# Altium schematic sheet Schematic1_3.SchDoc (part 3 of 3)
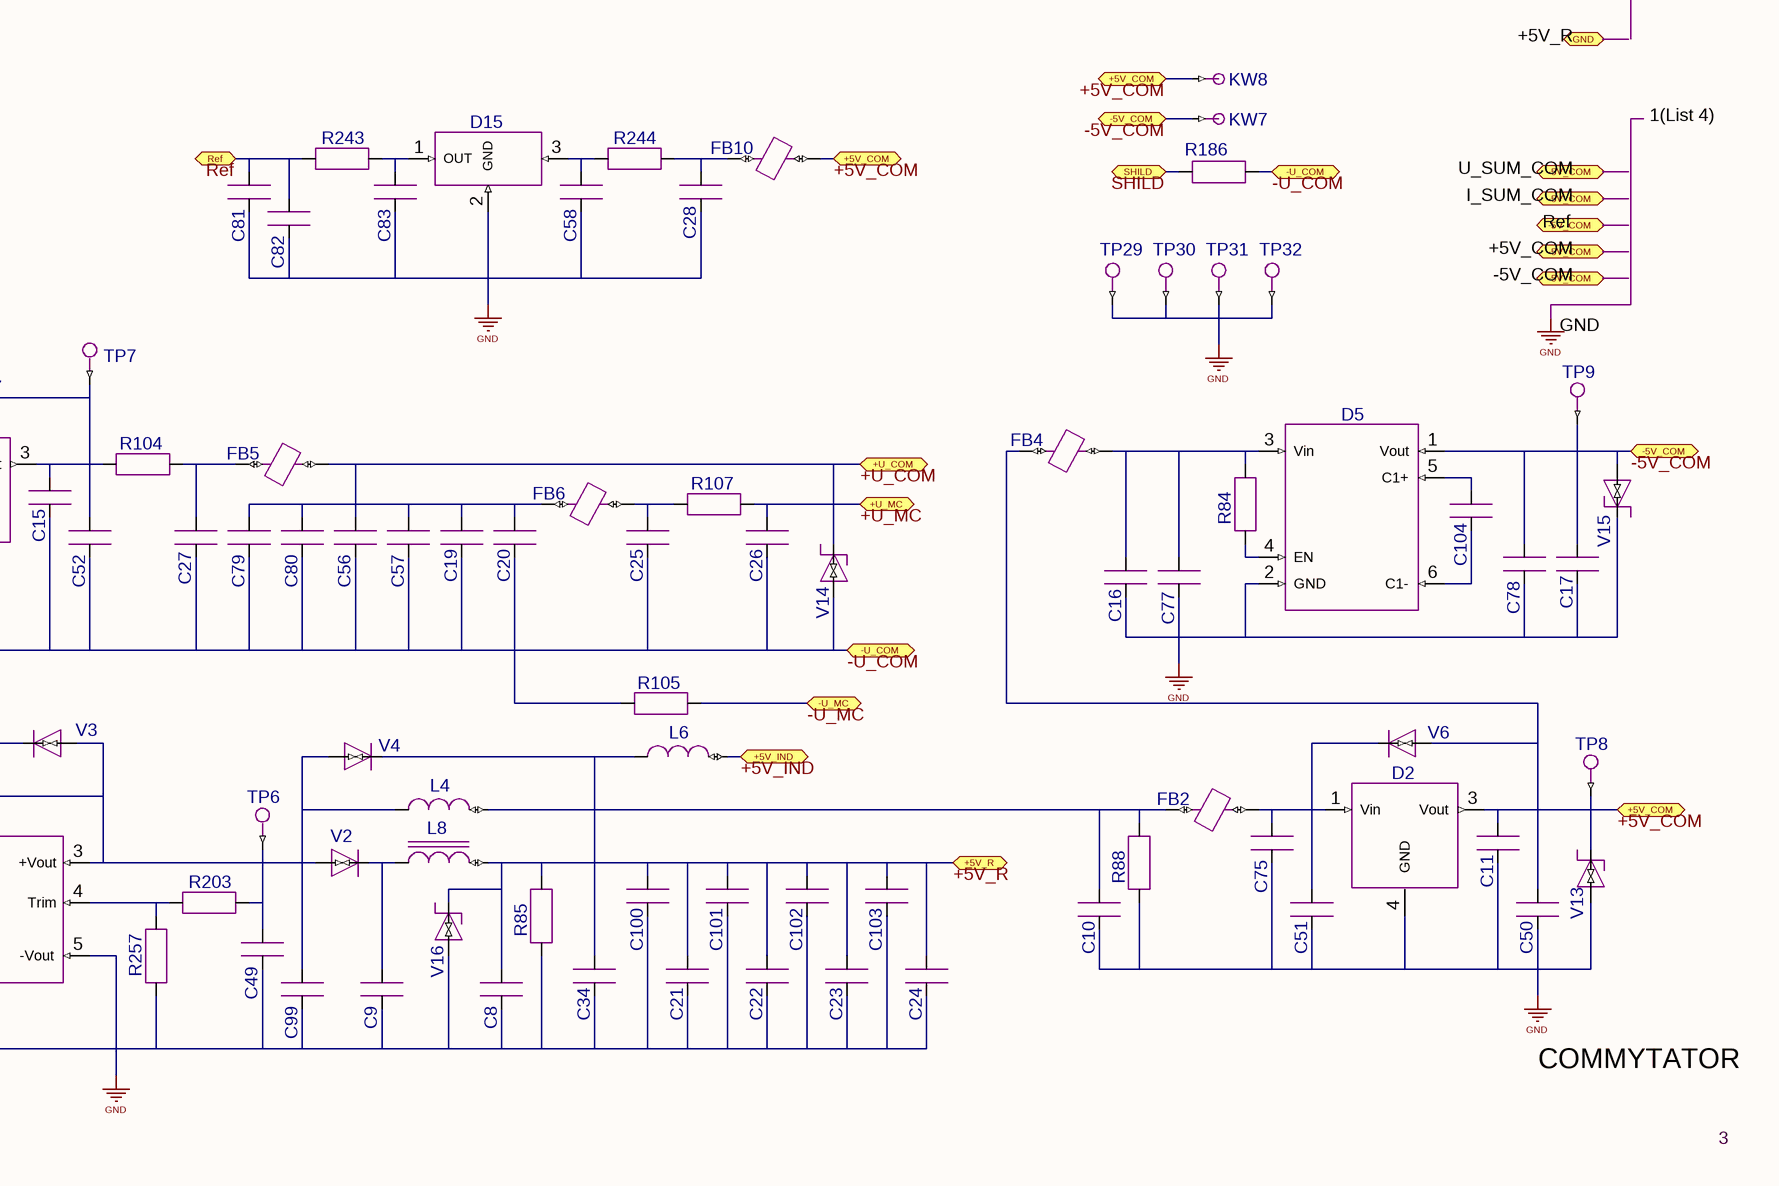
[diagram p4: Schematic1_3.SchDoc, bottom right]

## Library data of the parts (continued)
TP8 = TEST POINT PC MULTI PURPOSE RED: 5010; Cell Name: TEST-POINTS-1; CmpIndex: 221; Ref Designator: TP8; Symbol name: TEST-POINTS-4.1; SymIndex: 9; Part Name: TEST POINT PC MULTI PURPOSE RED; Part Number: 5010
TP9 = TEST POINT PC MULTI PURPOSE RED: 5010; Cell Name: TEST-POINTS-1; CmpIndex: 222; Ref Designator: TP9; Symbol name: TEST-POINTS-4.1; SymIndex: 9; Part Name: TEST POINT PC MULTI PURPOSE RED; Part Number: 5010
TP10 = TEST POINT PC MULTI PURPOSE RED: 5010; Cell Name: TEST-POINTS-1; CmpIndex: 224; Ref Designator: TP10; Symbol name: TEST-POINTS-4.1; SymIndex: 9; Part Name: TEST POINT PC MULTI PURPOSE RED; Part Number: 5010
TP28 = TEST POINT PC MULTIPURPOSE BRWN: 5125; Cell Name: TEST-POINTS-1; CmpIndex: 67; Ref Designator: TP28; Symbol name: TEST-POINTS-4.1; SymIndex: 9; Part Name: TEST POINT PC MULTIPURPOSE BRWN; Part Number: 5125
TP29 = TEST POINT PC MULTI PURPOSE GRN: 5126; Cell Name: TEST-POINTS-1; CmpIndex: 225; Ref Designator: TP29; Symbol name: TEST-POINTS-4.1; SymIndex: 9; Part Name: TEST POINT PC MULTI PURPOSE GRN; Part Number: 5126
TP30 = TEST POINT PC MULTI PURPOSE GRN: 5126; Cell Name: TEST-POINTS-1; CmpIndex: 226; Ref Designator: TP30; Symbol name: TEST-POINTS-4.1; SymIndex: 9; Part Name: TEST POINT PC MULTI PURPOSE GRN; Part Number: 5126
TP31 = TEST POINT PC MULTI PURPOSE GRN: 5126; Cell Name: TEST-POINTS-1; CmpIndex: 227; Ref Designator: TP31; Symbol name: TEST-POINTS-4.1; SymIndex: 9; Part Name: TEST POINT PC MULTI PURPOSE GRN; Part Number: 5126
TP32 = TEST POINT PC MULTI PURPOSE GRN: 5126; Cell Name: TEST-POINTS-1; CmpIndex: 228; Ref Designator: TP32; Symbol name: TEST-POINTS-4.1; SymIndex: 9; Part Name: TEST POINT PC MULTI PURPOSE GRN; Part Number: 5126
V1 = DIODE SCHOTTKY 60V 3A SMB: STPS3L60U; Part Label: 60V/3A; Cell Name: SMB-ST; CmpIndex: 24; Ref Designator: V1; Symbol name: DIODE-SXEM-1.1; SymIndex: 18; Part Name: DIODE SCHOTTKY 60V 3A SMB; Part Number: STPS3L60U
V2 = DIODE SCHOTTKY 60V 3A SMB: STPS3L60U; Part Label: 60V/3A; Cell Name: SMB-ST; CmpIndex: 75; Ref Designator: V2; Symbol name: DIODE-SXEM-1.1; SymIndex: 18; Part Name: DIODE SCHOTTKY 60V 3A SMB; Part Number: STPS3L60U
V3 = DIODE SCHOTTKY 60V 3A SMB: STPS3L60U; Part Label: 60V/3A; Cell Name: SMB-ST; CmpIndex: 128; Ref Designator: V3; Symbol name: DIODE-SXEM-1.1; SymIndex: 18; Part Name: DIODE SCHOTTKY 60V 3A SMB; Part Number: STPS3L60U
V4 = DIODE SCHOTTKY 60V 3A SMB: STPS3L60U; Part Label: 60V/3A; Cell Name: SMB-ST; CmpIndex: 837; Ref Designator: V4; Symbol name: DIODE-SXEM-1.1; SymIndex: 18; Part Name: DIODE SCHOTTKY 60V 3A SMB; Part Number: STPS3L60U
V5 = DIODE ZENER 5.1V 200MW UMD2: UDZSTE-175.1B; Part Label: 5,1V/2%/0,2W; Cell Name: SOD323F_SC90; CmpIndex: 28; Ref Designator: V5; Symbol name: STABILITRON-1.1; SymIndex: 52; Part Name: DIODE ZENER 5.1V 200MW UMD2; Part Number: UDZSTE-175.1B
V6 = DIODE SWITCH 100V 0.15A SOD123: 1N4148W-7-F; Part Label: 100V/0,15A; Cell Name: SOD123-DIODES; CmpIndex: 81; Ref Designator: V6; Symbol name: DIODE-SXEM-1.1; SymIndex: 18; Part Name: DIODE SWITCH 100V 0.15A SOD123; Part Number: 1N4148W-7-F
V7 = DIODE SWITCH 100V 0.15A SOD123: 1N4148W-7-F; Part Label: 100V/0,15A; Cell Name: SOD123-DIODES; CmpIndex: 102; Ref Designator: V7; Symbol name: DIODE-SXEM-1.1; SymIndex: 18; Part Name: DIODE SWITCH 100V 0.15A SOD123; Part Number: 1N4148W-7-F
V12 = TVS DIODE 45VWM 72.7VC SOD128: PTVS45VP1UP,115; Part Label: 45V; Cell Name: RTVSxP1UP; CmpIndex: 229; Ref Designator: V12; Symbol name: SUPPRESSOR-SXEM-1.1; SymIndex: 20; Part Name: TVS DIODE 45VWM 72.7VC SOD128; Part Number: PTVS45VP1UP,115
V13 = TVS DIODE 3.3VWM 8VC SOD128: PTVS3V3P1UP,115; Part Label: 3,3V; Cell Name: RTVSxP1UP; CmpIndex: 230; Ref Designator: V13; Symbol name: SUPPRESSOR-SXEM-1.1; SymIndex: 20; Part Name: TVS DIODE 3.3VWM 8VC SOD128; Part Number: PTVS3V3P1UP,115
V14 = TVS DIODE 3.3VWM 8VC SOD128: PTVS3V3P1UP,115; Part Label: 3,3V; Cell Name: RTVSxP1UP; CmpIndex: 423; Ref Designator: V14; Symbol name: SUPPRESSOR-SXEM-1.1; SymIndex: 20; Part Name: TVS DIODE 3.3VWM 8VC SOD128; Part Number: PTVS3V3P1UP,115
V15 = TVS DIODE 3.3VWM 8VC SOD128: PTVS3V3P1UP,115; Part Label: 3,3V; Cell Name: RTVSxP1UP; CmpIndex: 427; Ref Designator: V15; Symbol name: SUPPRESSOR-SXEM-1.1; SymIndex: 20; Part Name: TVS DIODE 3.3VWM 8VC SOD128; Part Number: PTVS3V3P1UP,115
V16 = TVS DIODE 3.3VWM 8VC SOD128: PTVS3V3P1UP,115; Part Label: 3,3V; Cell Name: RTVSxP1UP; CmpIndex: 430; Ref Designator: V16; Symbol name: SUPPRESSOR-SXEM-1.1; SymIndex: 20; Part Name: TVS DIODE 3.3VWM 8VC SOD128; Part Number: PTVS3V3P1UP,115
V17 = DIODE ZENER 3.0V 200MW UMD2: UDZSTE-173.0B; Part Label: 3,0V/3%/0,2W; Cell Name: SOD323F_SC90; CmpIndex: 1004; Ref Designator: V17; Symbol name: STABILITRON-1.1; SymIndex: 52; Part Name: DIODE ZENER 3.0V 200MW UMD2; Part Number: UDZSTE-173.0B
X17 = CONN HEADER 2.54MM 20POS GOLD: SBH11-PBPC-D10-ST-BK; Part Label: 20/V/2,54; Cell Name: IDS-20-V-2,54; CmpIndex: 267; Ref Designator: X17; Symbol name: PLD-20.1; SymIndex: 65; Part Name: CONN HEADER 2.54MM 20POS GOLD; Part Number: SBH11-PBPC-D10-ST-BK
X18 = CONN HEADER 2.54MM 16POS GOLD: SBH11-PBPC-D08-ST-BK; Part Label: 16/V/2,54; CmpIndex: 358; Ref Designator: X18; Symbol name: PLD-16.1; SymIndex: 66; Part Name: CONN HEADER 2.54MM 16POS GOLD; Part Number: SBH11-PBPC-D08-ST-BK
X22 = CONN HEADER 4POS 4.2MM VERT TIN: 0039281043; Part Label: 4K; Cell Name: 2Rx4K; CmpIndex: 1416; Ref Designator: X22; Symbol name: MICRO_FIT_4.1; SymIndex: 74; Part Name: CONN HEADER 4POS 4.2MM VERT TIN; Part Number: 0039281043